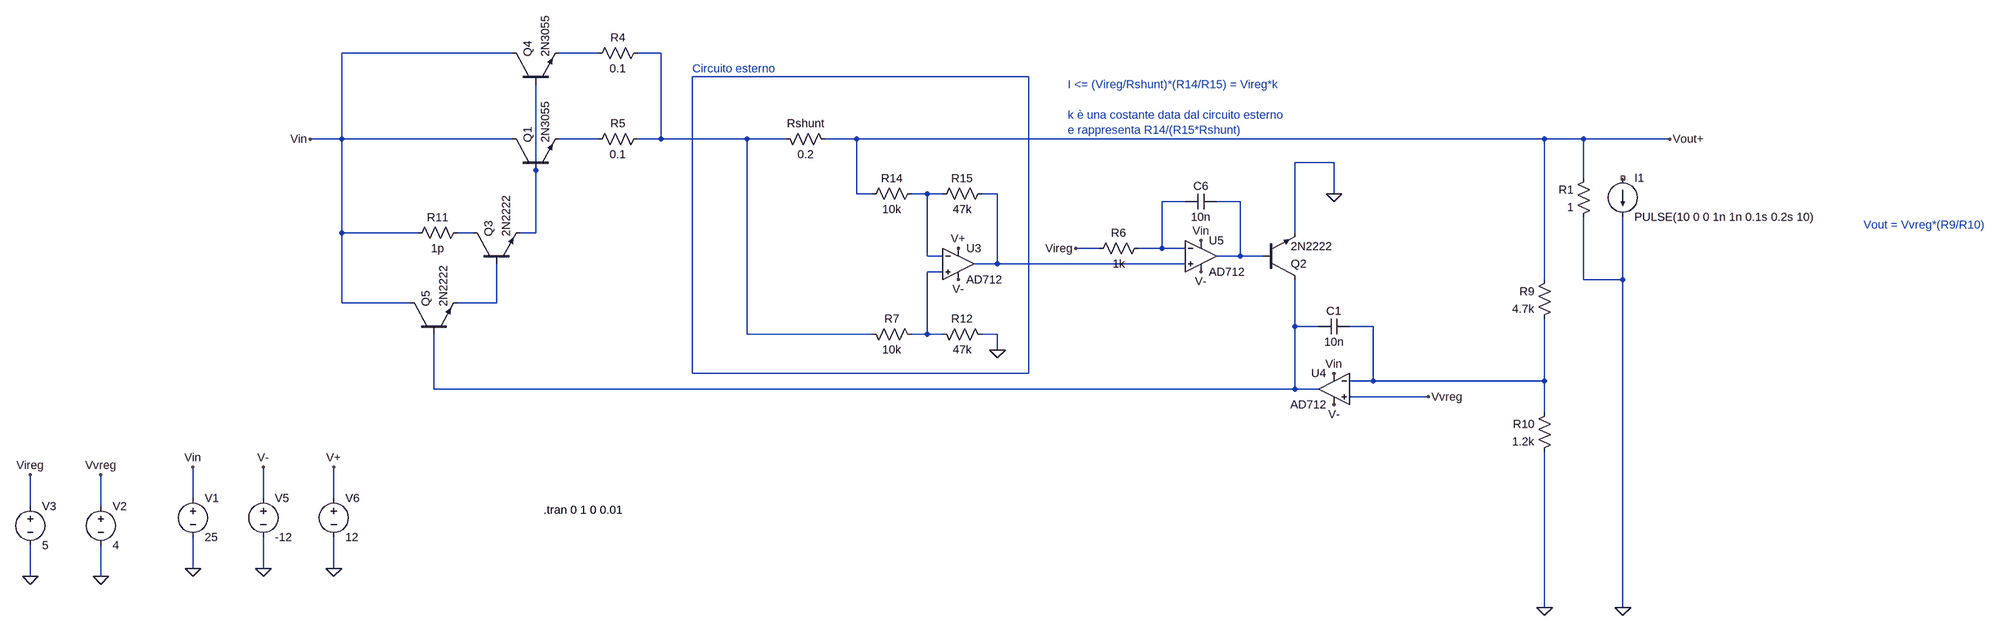
[diagram p0: schematic ALimentatore.asc]
ALimentatore.asc, the LTspice schematic file:
Version 4
SHEET 1 3308 680
WIRE -864 -672 -1216 -672
WIRE -688 -672 -768 -672
WIRE -560 -672 -608 -672
WIRE 192 -624 -496 -624
WIRE -1216 -496 -1216 -672
WIRE -1216 -496 -1280 -496
WIRE -864 -496 -1216 -496
WIRE -688 -496 -768 -496
WIRE -560 -496 -560 -672
WIRE -560 -496 -608 -496
WIRE -384 -496 -560 -496
WIRE -304 -496 -384 -496
WIRE -160 -496 -224 -496
WIRE 1328 -496 -160 -496
WIRE 1408 -496 1328 -496
WIRE 1584 -496 1408 -496
WIRE 816 -448 736 -448
WIRE -816 -432 -816 -608
WIRE 1408 -416 1408 -496
WIRE -160 -384 -160 -496
WIRE -128 -384 -160 -384
WIRE -16 -384 -48 -384
WIRE 16 -384 -16 -384
WIRE 128 -384 96 -384
WIRE 816 -384 816 -448
WIRE 512 -368 464 -368
WIRE 624 -368 576 -368
WIRE -1216 -304 -1216 -496
WIRE -1056 -304 -1216 -304
WIRE -944 -304 -976 -304
WIRE -816 -304 -816 -432
WIRE -816 -304 -848 -304
WIRE 736 -304 736 -448
WIRE 336 -272 288 -272
WIRE 464 -272 464 -368
WIRE 464 -272 416 -272
WIRE 512 -272 464 -272
WIRE -16 -256 -16 -384
WIRE 16 -256 -16 -256
WIRE 624 -256 624 -368
WIRE 624 -256 576 -256
WIRE 672 -256 624 -256
WIRE 128 -240 128 -384
WIRE 128 -240 80 -240
WIRE 512 -240 128 -240
WIRE 16 -224 -16 -224
WIRE 1328 -208 1328 -496
WIRE 1408 -208 1408 -336
WIRE 1488 -208 1488 -336
WIRE 1488 -208 1408 -208
WIRE -1216 -160 -1216 -304
WIRE -1072 -160 -1216 -160
WIRE -896 -160 -896 -240
WIRE -896 -160 -976 -160
WIRE 736 -112 736 -208
WIRE 784 -112 736 -112
WIRE 896 -112 848 -112
WIRE -384 -96 -384 -496
WIRE -128 -96 -384 -96
WIRE -16 -96 -16 -224
WIRE -16 -96 -48 -96
WIRE 16 -96 -16 -96
WIRE 128 -96 96 -96
WIRE 128 -64 128 -96
WIRE -496 -16 -496 -624
WIRE 192 -16 192 -624
WIRE 192 -16 -496 -16
WIRE 896 0 896 -112
WIRE 896 0 848 0
WIRE 1328 0 1328 -128
WIRE 1328 0 896 0
WIRE -1024 16 -1024 -96
WIRE 736 16 736 -112
WIRE 736 16 -1024 16
WIRE 784 16 736 16
WIRE 1056 32 848 32
WIRE 1328 64 1328 0
WIRE -1520 240 -1520 176
WIRE -1376 240 -1376 176
WIRE -1232 240 -1232 176
WIRE -1984 256 -1984 192
WIRE -1840 256 -1840 192
WIRE -1520 384 -1520 320
WIRE -1376 384 -1376 320
WIRE -1232 384 -1232 320
WIRE -1984 400 -1984 336
WIRE -1840 400 -1840 336
WIRE 1328 464 1328 144
WIRE 1488 464 1488 -208
FLAG -1280 -496 Vin
FLAG -1840 192 Vvreg
FLAG -1840 400 0
FLAG 1056 32 Vvreg
FLAG -1520 176 Vin
FLAG -1520 384 0
FLAG -1984 192 Vireg
FLAG -1984 400 0
FLAG 288 -272 Vireg
FLAG 816 -384 0
FLAG 1584 -496 Vout+
FLAG 1328 464 0
FLAG -1376 176 V-
FLAG -1376 384 0
FLAG -1232 176 V+
FLAG -1232 384 0
FLAG 48 -208 V-
FLAG 544 -224 V-
FLAG 816 48 V-
FLAG 128 -64 0
FLAG 1488 464 0
FLAG 544 -288 Vin
FLAG 816 -16 Vin
FLAG 48 -272 V+
SYMBOL npn -864 -432 R270
SYMATTR InstName Q1
SYMATTR Value 2N3055
SYMBOL npn 672 -208 M180
SYMATTR InstName Q2
SYMATTR Value 2N2222
SYMBOL res -320 -512 M90
WINDOW 0 0 56 VBottom 2
WINDOW 3 32 56 VTop 2
SYMATTR InstName Rshunt
SYMATTR Value 0.2
SYMBOL npn -944 -240 R270
SYMATTR InstName Q3
SYMATTR Value 2N2222
SYMBOL npn -864 -608 R270
SYMATTR InstName Q4
SYMATTR Value 2N3055
SYMBOL res -592 -688 R90
WINDOW 0 0 56 VBottom 2
WINDOW 3 32 56 VTop 2
SYMATTR InstName R4
SYMATTR Value 0.1
SYMBOL res -592 -512 R90
WINDOW 0 0 56 VBottom 2
WINDOW 3 32 56 VTop 2
SYMATTR InstName R5
SYMATTR Value 0.1
SYMBOL res -960 -320 R90
WINDOW 0 0 56 VBottom 2
WINDOW 3 32 56 VTop 2
SYMATTR InstName R11
SYMATTR Value 1p
SYMBOL voltage -1840 240 R0
WINDOW 123 0 0 Left 0
WINDOW 39 0 0 Left 0
SYMATTR InstName V2
SYMATTR Value 4
SYMBOL voltage -1520 224 R0
WINDOW 123 0 0 Left 0
WINDOW 39 0 0 Left 0
SYMATTR InstName V1
SYMATTR Value 25
SYMBOL voltage -1984 240 R0
WINDOW 123 0 0 Left 0
WINDOW 39 0 0 Left 0
SYMATTR InstName V3
SYMATTR Value 5
SYMBOL OpAmps\\AD712 816 -48 M0
SYMATTR InstName U4
SYMBOL OpAmps\\AD712 48 -304 R0
SYMATTR InstName U3
SYMBOL res -32 -400 R90
WINDOW 0 0 56 VBottom 2
WINDOW 3 32 56 VTop 2
SYMATTR InstName R14
SYMATTR Value 10k
SYMBOL res 112 -400 R90
WINDOW 0 0 56 VBottom 2
WINDOW 3 32 56 VTop 2
SYMATTR InstName R15
SYMATTR Value 47k
SYMBOL OpAmps\\AD712 544 -320 R0
SYMATTR InstName U5
SYMBOL cap 576 -384 R90
WINDOW 0 0 32 VBottom 2
WINDOW 3 32 32 VTop 2
SYMATTR InstName C6
SYMATTR Value 10n
SYMBOL res 432 -288 R90
WINDOW 0 0 56 VBottom 2
WINDOW 3 32 56 VTop 2
SYMATTR InstName R6
SYMATTR Value 1k
SYMBOL npn -1072 -96 R270
SYMATTR InstName Q5
SYMATTR Value 2N2222
SYMBOL res 1344 -224 M0
SYMATTR InstName R9
SYMATTR Value 4.7k
SYMBOL res 1344 48 M0
SYMATTR InstName R10
SYMATTR Value 1.2k
SYMBOL voltage -1376 224 R0
WINDOW 123 0 0 Left 0
WINDOW 39 0 0 Left 0
SYMATTR InstName V5
SYMATTR Value -12
SYMBOL voltage -1232 224 R0
WINDOW 123 0 0 Left 0
WINDOW 39 0 0 Left 0
SYMATTR InstName V6
SYMATTR Value 12
SYMBOL res -32 -80 M270
WINDOW 0 32 56 VTop 2
WINDOW 3 0 56 VBottom 2
SYMATTR InstName R7
SYMATTR Value 10k
SYMBOL res 112 -80 M270
WINDOW 0 32 56 VTop 2
WINDOW 3 0 56 VBottom 2
SYMATTR InstName R12
SYMATTR Value 47k
SYMBOL load2 1488 -416 R0
WINDOW 123 0 0 Left 0
WINDOW 39 0 0 Left 0
SYMATTR InstName I1
SYMATTR Value PULSE(10 0 0 1n 1n 0.1s 0.2s 10)
SYMBOL cap 848 -128 R90
WINDOW 0 0 32 VBottom 2
WINDOW 3 32 32 VTop 2
SYMATTR InstName C1
SYMATTR Value 10n
SYMBOL res 1424 -432 M0
SYMATTR InstName R1
SYMATTR Value 1
TEXT -800 264 Left 2 !.tran 0 1 0 0.01
TEXT 2080 -320 Left 2 ;Vout = Vvreg*(R9/R10)
TEXT 272 -608 Left 2 ;I <= (Vireg/Rshunt)*(R14/R15) = Vireg*k\n \nk è una costante data dal circuito esterno\ne rappresenta R14/(R15*Rshunt)
TEXT -496 -640 Left 2 ;Circuito esterno

The netlist it stands for:
* ALimentatore.asc
Q1 Vin N005 N004 0 2N3055
Q2 N013 N009 0 0 2N2222
Rshunt N002 Vout+ 0.2
Q3 N010 N012 N005 0 2N2222
Q4 Vin N005 N001 0 2N3055
R4 N002 N001 0.1
R5 N002 N004 0.1
R11 N010 Vin 1p
V2 Vvreg 0 4
V1 Vin 0 25
V3 Vireg 0 5
XU4 Vvreg N014 Vin V- N013 AD712  ; pins In+ In- V+ V- OUT
XU3 N011 N006 V+ V- N007 AD712  ; pins In+ In- V+ V- OUT
R14 N006 Vout+ 10k
R15 N007 N006 47k
XU5 N007 N008 Vin V- N009 AD712  ; pins In+ In- V+ V- OUT
C6 N009 N008 10n
R6 N008 Vireg 1k
Q5 Vin N013 N012 0 2N2222
R9 Vout+ N014 4.7k
R10 N014 0 1.2k
V5 V- 0 -12
V6 V+ 0 12
R7 N011 N002 10k
R12 0 N011 47k
I1 NC_01 0 PULSE(10 0 0 1n 1n 0.1s 0.2s 10)
C1 N014 N013 10n
R1 Vout+ 0 1
.model NPN NPN
.model PNP PNP
.lib standard.bjt
.tran 0 1 0 0.01
* Vout = Vvreg*(R9/R10)
* I <= (Vireg/Rshunt)*(R14/R15) = Vireg*k
* k è una costante data dal circuito esterno
* e rappresenta R14/(R15*Rshunt)
* Circuito esterno
.backanno
.end